# EasyEDA Pro project digital-stethoscope-filters.epro

# Schematic Schematic1
Board Name: Board1; Create Date: 2025-01-17; Page Name: P1; Project Name: TPF_DSP; Schematic Name: Schematic1; Update Date: 2025-01-17; Company: EasyEDA.com; Page Size: A4; Version: V1.0
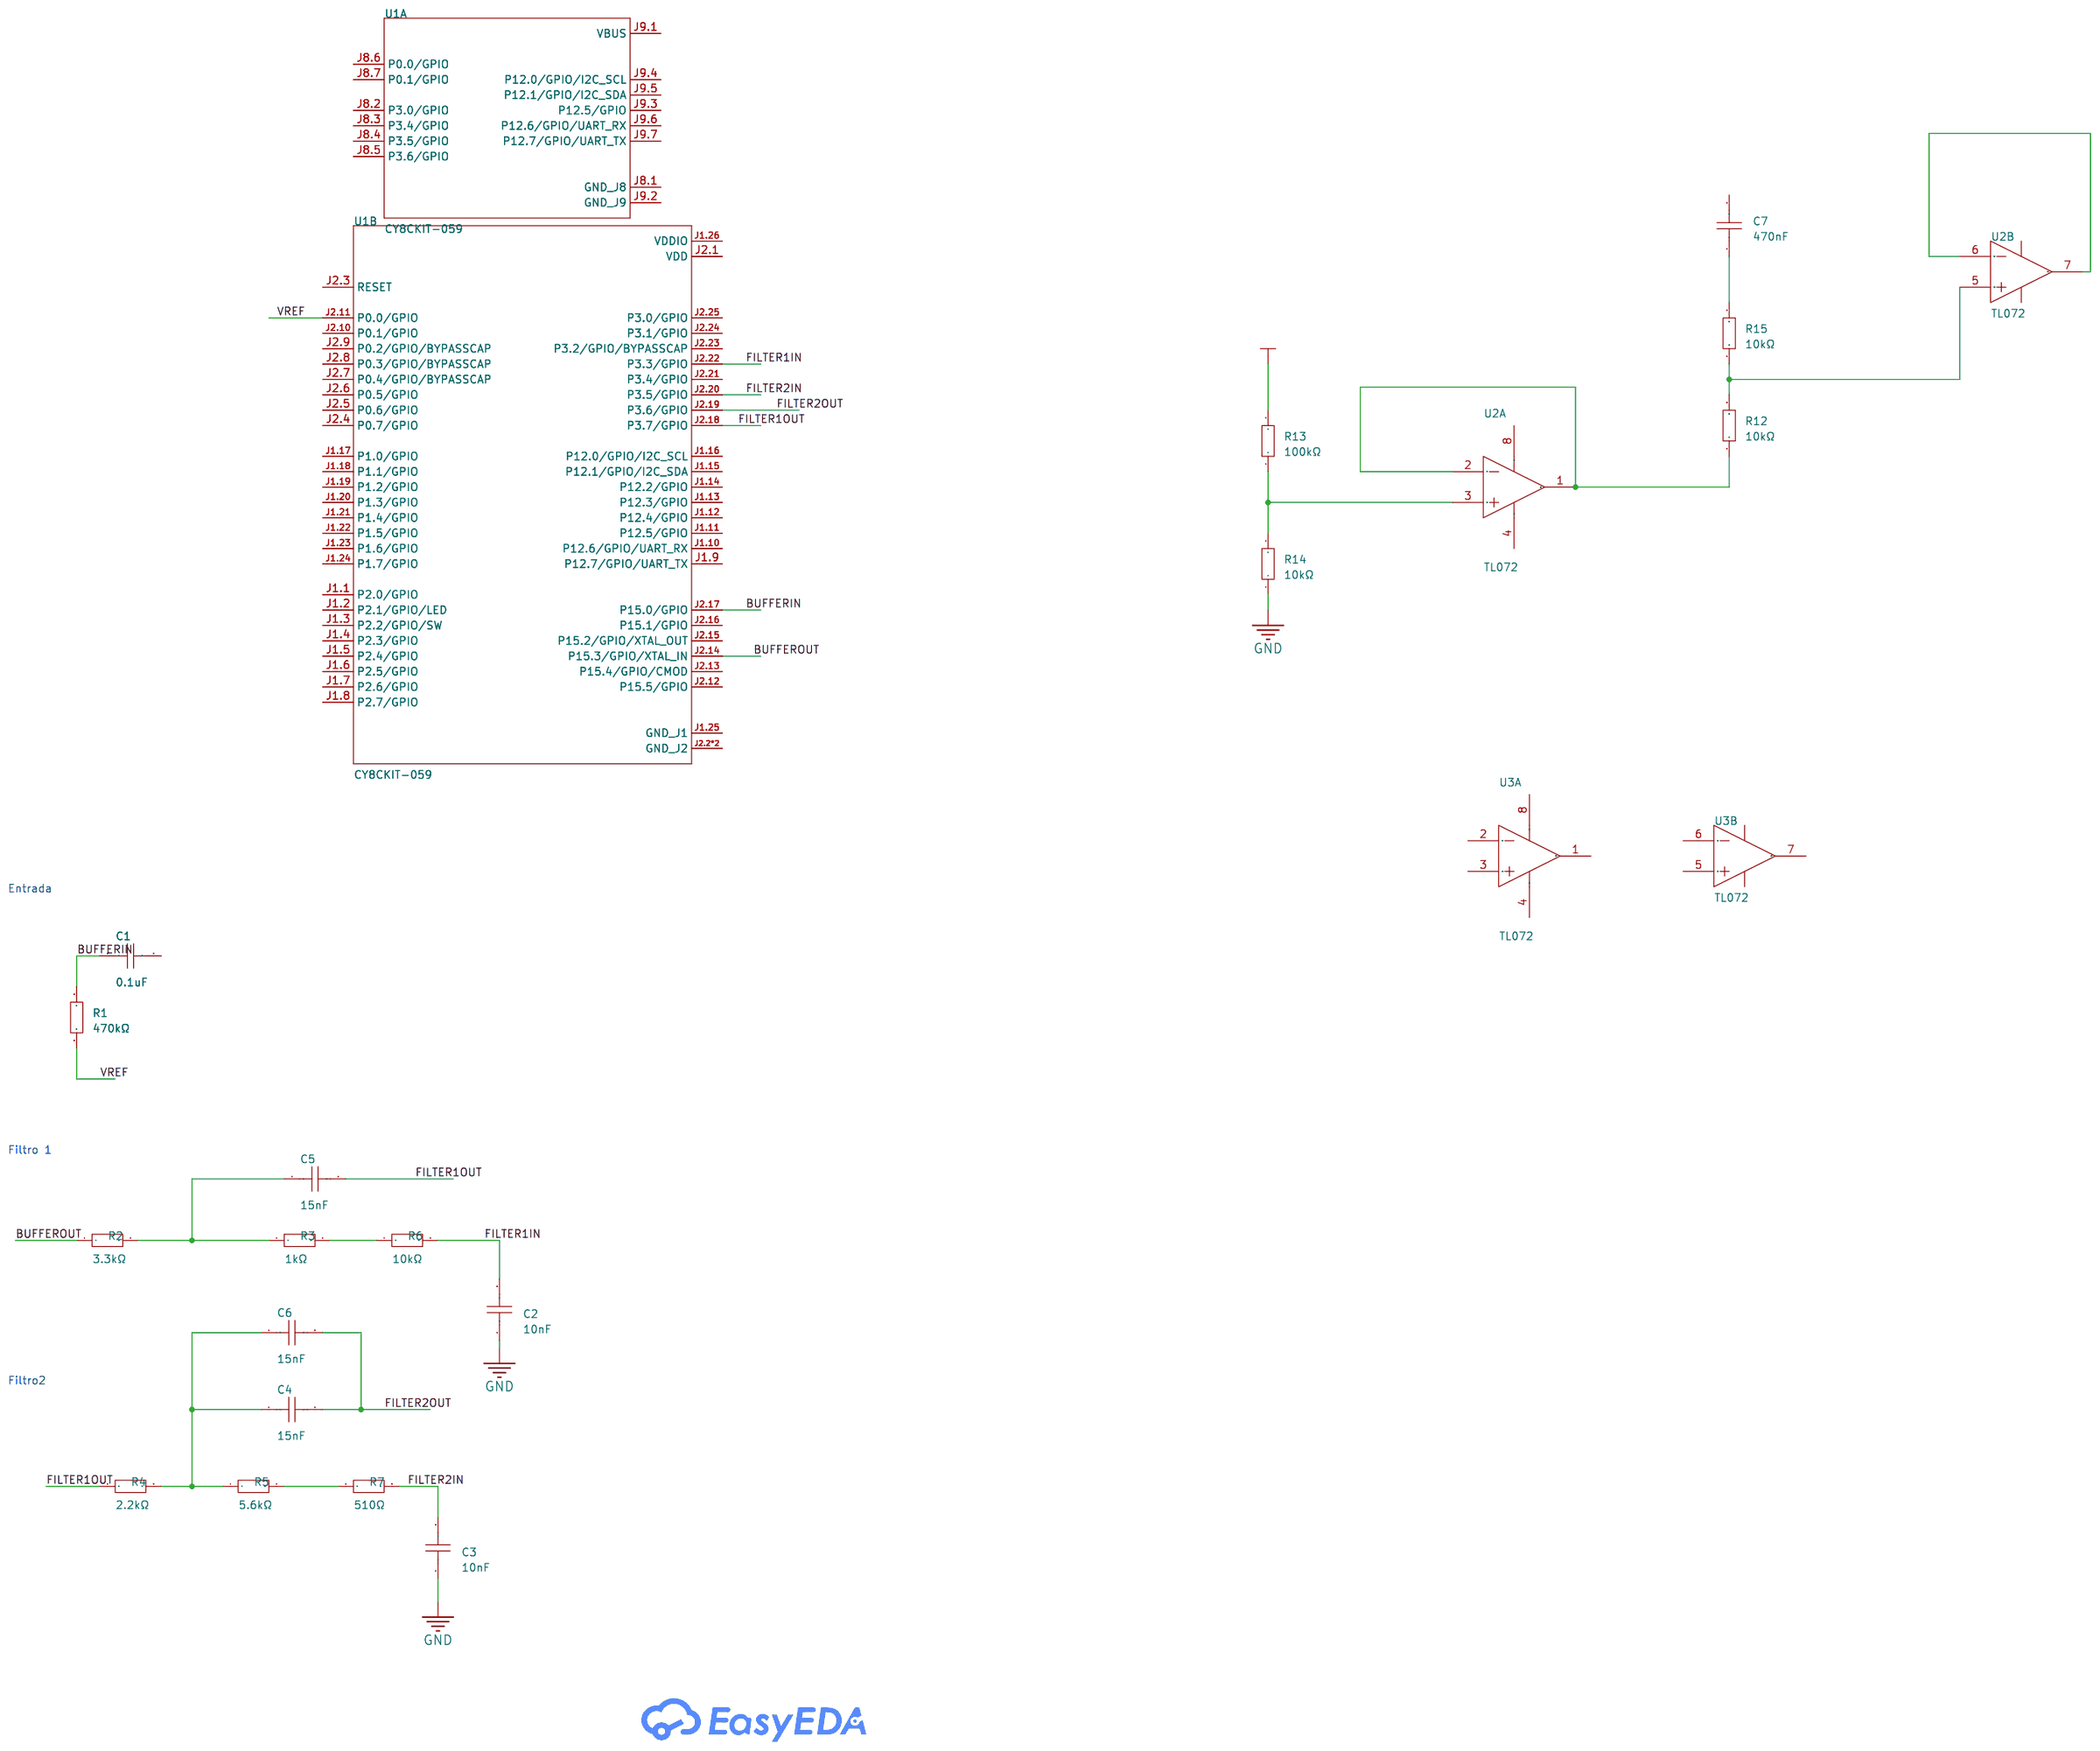
[diagram p0: schematic sheet]

## Parts
C1  0.1uF  [C0603]
C2  10nF  [C0603]
C3  10nF  [C0603]
C4  15nF  [C0603]
C5  15nF  [C0603]
C6  15nF  [C0603]
C7  470nF  [CAP-TH_L18.0-W8.0-P15.00-D0.8]
R1  470kΩ  [R_AXIAL-0.4]
R2  3.3kΩ  [R_AXIAL-0.4]
R3  1kΩ  [R_AXIAL-0.4]
R4  2.2kΩ  [R_AXIAL-0.4]
R5  5.6kΩ  [R_AXIAL-0.4]
R6  10kΩ  [R_AXIAL-0.4]
R7  510Ω  [R_AXIAL-0.4]
R12  10kΩ  [R_AXIAL-0.4]
R13  100kΩ  [R_AXIAL-0.4]
R14  10kΩ  [R_AXIAL-0.4]
R15  10kΩ  [R_AXIAL-0.4]
U1  CY8CKIT-059  [MODULE_CY8CKIT-059]  (sections G$1,G$2)
U2  TL072  [DIP-8_L9.7-W6.6-P2.54-LS7.6-BL]  (sections 1,2)
U3  TL072  [DIP-8_L9.7-W6.6-P2.54-LS7.6-BL]  (sections 1,2)

## Library data of the parts
C1-C6 = CAP_0603: Supplier Footprint: 0603
C7 = L22G474KQ138170130070EOZ: Capacitance:470nF Tolerance:±10% Tolerance:±10% Voltage Rated: Dielectric Material:Metallized Polyester Operating Temperature:-40℃~+125℃ Operating Temperature:-40℃~+125℃; LCSC Part Name: 470nF ±10% 400V; Supplier Part: C2893962; Manufacturer: STE(松田); Supplier Footprint: 插件,P=15mm; JLCPCB Part Class: Extended Part; Datasheet: https://atta.szlcsc.com/upload/public/pdf/source/20210914/9577881C568D4F76FB11E9DE1425BA7C.pdf; Supplier: LCSC; Tolerance: ±10%; Dielectric Material: Metallized Polyester; Operating Temperature: -40℃~+125℃
R1-R7 R12-R15 = Res_AXIAL-1/4W: Supplier Footprint: Through
U1 = CY8CKIT-059
U2 U3 = TL072: LCSC Part Name: 低噪声JFET输入双运放; Supplier Part: C529228; Manufacturer: Gcore(扬州国芯); Supplier Footprint: DIP-8; JLCPCB Part Class: Extended Part; Supplier: LCSC

## Nets
+12V: R13.2
GND: C2.1 C3.1 R14.1
BUFFERIN: C1.1 R1.2 U1.J2.17(P15.0/GPIO)
BUFFEROUT: R2.1 U1.J2.14(P15.3/GPIO/XTAL_IN)
FILTER1IN: C2.2 R6.2 U1.J2.22(P3.3/GPIO)
FILTER1OUT: C5.2 R4.1 U1.J2.18(P3.7/GPIO)
FILTER2IN: C3.2 R7.2 U1.J2.20(P3.5/GPIO)
FILTER2OUT: C4.2 C6.2 U1.J2.19(P3.6/GPIO)
VREF: R1.1 U1.J2.11(P0.0/GPIO)
$1N2999: C4.1 C6.1 R4.2 R5.1
$1N3099: R3.2 R6.1
$1N3177: R5.2 R7.1
$1N3454: C5.1 R2.2 R3.1
Net-(C7-1): C7.1 R15.2
Net-(R12-1): R12.1 U2.1(1OUT) U2.2(1IN-)
Net-(R12-2): R12.2 R15.1 U2.5(2IN+)
Net-(R13-1): R13.1 R14.2 U2.3(1IN+)
Net-(U2-6): U2.6(2IN-) U2.7(2OUT)

Not connected (* = marked no-connect by the designer): C1 2; C7 2; U1 J1.1(P2.0/GPIO) J1.2(P2.1/GPIO/LED) J1.3(P2.2/GPIO/SW) J1.4(P2.3/GPIO) J1.5(P2.4/GPIO) J1.6(P2.5/GPIO) J1.7(P2.6/GPIO) J1.8(P2.7/GPIO) J1.9(P12.7/GPIO/UART_TX) J1.10(P12.6/GPIO/UART_RX) J1.11(P12.5/GPIO) J1.12(P12.4/GPIO) J1.13(P12.3/GPIO) J1.14(P12.2/GPIO) J1.15(P12.1/GPIO/I2C_SDA) J1.16(P12.0/GPIO/I2C_SCL) J1.17(P1.0/GPIO) J1.18(P1.1/GPIO) J1.19(P1.2/GPIO) J1.20(P1.3/GPIO) J1.21(P1.4/GPIO) J1.22(P1.5/GPIO) J1.23(P1.6/GPIO) J1.24(P1.7/GPIO) J1.25(GND_J1) J1.26(VDDIO) J2.1(VDD) J2.2*2(GND_J2) J2.3(RESET) J2.4(P0.7/GPIO) J2.5(P0.6/GPIO) J2.6(P0.5/GPIO) J2.7(P0.4/GPIO/BYPASSCAP) J2.8(P0.3/GPIO/BYPASSCAP) J2.9(P0.2/GPIO/BYPASSCAP) J2.10(P0.1/GPIO) J2.12(P15.5/GPIO) J2.13(P15.4/GPIO/CMOD) J2.15(P15.2/GPIO/XTAL_OUT) J2.16(P15.1/GPIO) J2.21(P3.4/GPIO) J2.23(P3.2/GPIO/BYPASSCAP) J2.24(P3.1/GPIO) J2.25(P3.0/GPIO) J8.1(GND_J8) J8.2(P3.0/GPIO) J8.3(P3.4/GPIO) J8.4(P3.5/GPIO) J8.5(P3.6/GPIO) J8.6(P0.0/GPIO) J8.7(P0.1/GPIO) J9.1(VBUS) J9.2(GND_J9) J9.3(P12.5/GPIO) J9.4(P12.0/GPIO/I2C_SCL) J9.5(P12.1/GPIO/I2C_SDA) J9.6(P12.6/GPIO/UART_RX) J9.7(P12.7/GPIO/UART_TX); U2 4(VCC-) 8(VCC+); U3 1(1OUT) 2(1IN-) 3(1IN+) 4(VCC-) 5(2IN+) 6(2IN-) 7(2OUT) 8(VCC+)

## Notes on the sheet
- Entrada
- Filtro 1
- Filtro2
